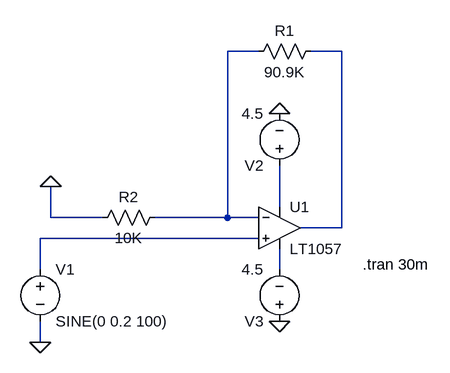
[diagram p0: schematic noninv_gain10.asc]
noninv_gain10.asc, the LTspice schematic file:
Version 4.1
SHEET 1 880 680
WIRE 160 -128 112 -128
WIRE 288 -128 240 -128
WIRE 192 112 192 48
WIRE -160 128 -160 80
WIRE -80 128 -160 128
WIRE 112 128 112 -128
WIRE 112 128 0 128
WIRE 160 128 112 128
WIRE 288 144 288 -128
WIRE 288 144 224 144
WIRE 160 160 -176 160
WIRE -176 208 -176 160
WIRE 192 208 192 176
WIRE -176 320 -176 288
FLAG -160 80 0
FLAG -176 320 0
FLAG 192 -32 0
FLAG 192 288 0
SYMBOL OpAmps\\LT1057 192 80 R0
SYMATTR InstName U1
SYMBOL res 256 -144 R90
WINDOW 0 0 56 VBottom 2
WINDOW 3 32 56 VTop 2
SYMATTR InstName R1
SYMATTR Value 90.9K
SYMATTR SpiceLine tol=1 pwr=0.1
SYMBOL res 16 112 R90
WINDOW 0 0 56 VBottom 2
WINDOW 3 32 56 VTop 2
SYMATTR InstName R2
SYMATTR Value 10K
SYMATTR SpiceLine tol=1 pwr=0.1
SYMBOL voltage -176 192 R0
WINDOW 123 0 0 Left 0
WINDOW 39 0 0 Left 0
SYMATTR InstName V1
SYMATTR Value SINE(0 0.2 100)
SYMBOL voltage 192 64 R180
WINDOW 123 0 0 Left 0
WINDOW 39 0 0 Left 0
SYMATTR InstName V2
SYMATTR Value 4.5
SYMBOL voltage 192 304 R180
WINDOW 123 0 0 Left 0
WINDOW 39 0 0 Left 0
SYMATTR InstName V3
SYMATTR Value 4.5
TEXT 320 200 Left 2 !.tran 30m

The netlist it stands for:
* noninv_gain10.asc
X§U1 N004 N001 N003 N005 N002 LT1057  ; pins In+ In- V+ V- OUT
R1 N002 N001 90.9K tol=1 pwr=0.1
R2 N001 0 10K tol=1 pwr=0.1
V1 N004 0 SINE(0 0.2 100)
V2 N003 0 4.5
V3 0 N005 4.5
.tran 30m
.lib LTC.lib
.backanno
.end